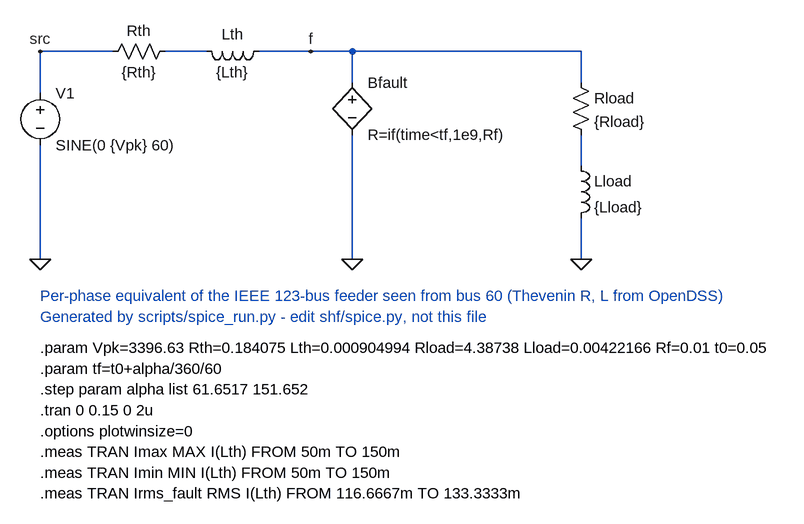
[diagram p0: schematic fault_dc_offset.asc]
fault_dc_offset.asc, the LTspice schematic file:
Version 4.1
SHEET 1 1120 880
WIRE 64 112 64 176
WIRE 176 112 64 112
WIRE 320 112 256 112
WIRE 544 112 400 112
WIRE 896 112 544 112
WIRE 544 160 544 112
WIRE 896 160 896 112
WIRE 896 288 896 240
WIRE 64 432 64 256
WIRE 544 432 544 240
WIRE 896 432 896 368
FLAG 64 112 src
FLAG 480 112 f
FLAG 64 432 0
FLAG 544 432 0
FLAG 896 432 0
SYMBOL voltage 64 160 R0
SYMATTR InstName V1
SYMATTR Value SINE(0 {Vpk} 60)
SYMBOL res 272 96 R90
WINDOW 0 0 56 VBottom 2
WINDOW 3 32 56 VTop 2
SYMATTR InstName Rth
SYMATTR Value {Rth}
SYMBOL ind 416 96 R90
WINDOW 0 5 56 VBottom 2
WINDOW 3 32 56 VTop 2
SYMATTR InstName Lth
SYMATTR Value {Lth}
SYMATTR SpiceLine Rser=0
SYMBOL bv 544 144 R0
SYMATTR InstName Bfault
SYMATTR Value R=if(time<tf,1e9,Rf)
SYMBOL res 880 144 R0
SYMATTR InstName Rload
SYMATTR Value {Rload}
SYMBOL ind 880 272 R0
SYMATTR InstName Lload
SYMATTR Value {Lload}
SYMATTR SpiceLine Rser=0
TEXT 64 488 Left 2 ;Per-phase equivalent of the IEEE 123-bus feeder seen from bus 60 (Thevenin R, L from OpenDSS)
TEXT 64 520 Left 2 ;Generated by scripts/spice_run.py - edit shf/spice.py, not this file
TEXT 64 568 Left 2 !.param Vpk=3396.63 Rth=0.184075 Lth=0.000904994 Rload=4.38738 Lload=0.00422166 Rf=0.01 t0=0.05
TEXT 64 600 Left 2 !.param tf=t0+alpha/360/60
TEXT 64 632 Left 2 !.step param alpha list 61.6517 151.652
TEXT 64 664 Left 2 !.tran 0 0.15 0 2u
TEXT 64 696 Left 2 !.options plotwinsize=0
TEXT 64 728 Left 2 !.meas TRAN Imax MAX I(Lth) FROM 50m TO 150m
TEXT 64 760 Left 2 !.meas TRAN Imin MIN I(Lth) FROM 50m TO 150m
TEXT 64 792 Left 2 !.meas TRAN Irms_fault RMS I(Lth) FROM 116.6667m TO 133.3333m

The netlist it stands for:
* fault_dc_offset.asc
V1 src 0 SINE(0 {Vpk} 60)
Rth N001 src {Rth}
Lth f N001 {Lth} Rser=0
Bfault f 0 R=if(time<tf,1e9,Rf)
Rload f N002 {Rload}
Lload N002 0 {Lload} Rser=0
* Per-phase equivalent of the IEEE 123-bus feeder seen from bus 60 (Thevenin R, L from OpenDSS)
* Generated by scripts/spice_run.py - edit shf/spice.py, not this file
.param Vpk=3396.63 Rth=0.184075 Lth=0.000904994 Rload=4.38738 Lload=0.00422166 Rf=0.01 t0=0.05
.param tf=t0+alpha/360/60
.step param alpha list 61.6517 151.652
.tran 0 0.15 0 2u
.options plotwinsize=0
.meas TRAN Imax MAX I(Lth) FROM 50m TO 150m
.meas TRAN Imin MIN I(Lth) FROM 50m TO 150m
.meas TRAN Irms_fault RMS I(Lth) FROM 116.6667m TO 133.3333m
.backanno
.end